# Altium schematic sheet RV1126_AUDIO_SHEET.SchDoc
size A4; SheetNumber: 13; SheetTotal: 28
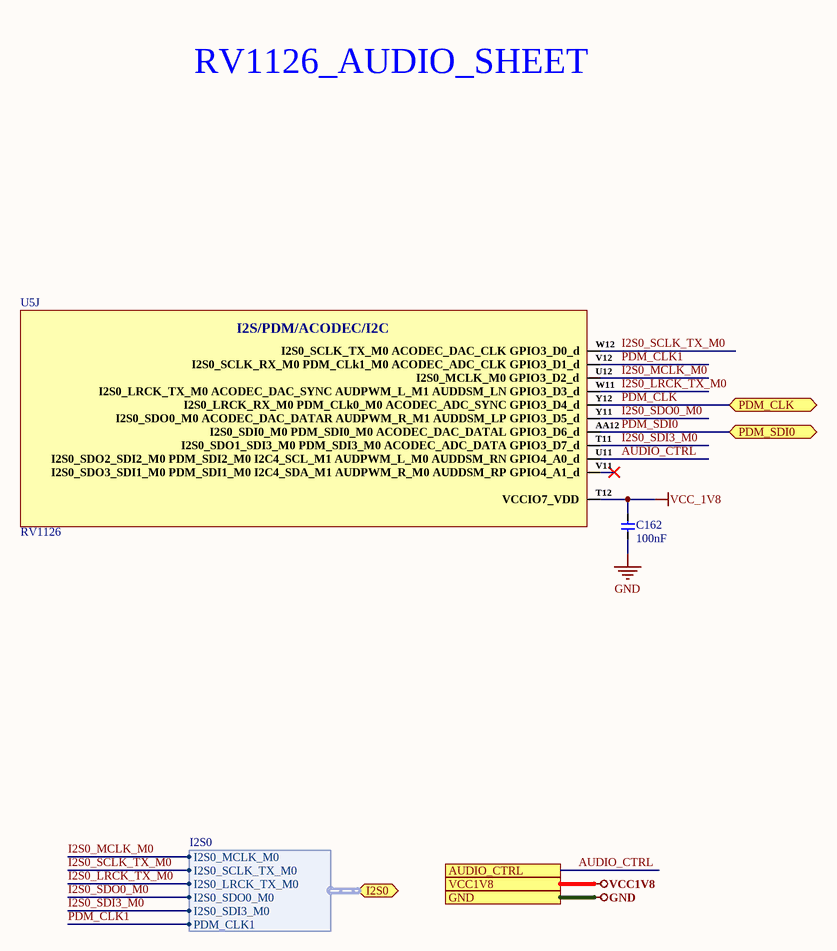
[diagram p0: RV1126_AUDIO_SHEET.SchDoc]

## Parts
C162  100nF  [CAP-0201]
U5  RV1126  [FCCSP-409(14x14)]  (part J of 15)

## Ports
AUDIO_CTRL (see SPEARKER_INTERFACE_SHEET[3C]), GND (see BUCK_CONTROLLER_SHEET2[3D], BUCK_CONVERTER_SHEET1[3D], DDR3_SDRAM_SHEET[5D], DEBUG_UART_INTERFACE[3D], DIGITAL_MEMS_INTERFACE[3C], eMMC_INTERFACE[3D], ETH_PoE-PD_INTERFACE[4D], ETH_SWITCH_INTERFACE[5D], IR-CUT_LIGHT SENSOR_SHEET[3D], MIPI TO HDMI_MODULE[3D], MIPI-CSI_RXX_INTERFACE[3C], PoE_PSE_CONTROLLER[5D], POWER_LDO_SHEET[3D], POWER_PMIC_RK809_CODEC[3C], POWER_PMIC_RK809_DC DC[3D], POWER_PMIC_RK809_LDO[4C], POWER_PMIC_RK809_MGM[3D], RV1126_DRAM_SHEET[4C], RV1126_eMMC_SPI-FLASH[3C], RV1126_ETHERNET_SHEET[3D], RV1126_OSC-PLL-PMUIO[3C], RV1126_POWER_SHEET[1D], RV1126_SARADC_SHEET[3C], RV1126_SDMMC_SHEET[3C], SPEARKER_INTERFACE_SHEET[3C], SPI_FLASH_INTERFACE[3D], USB2.0_DEBUG_UART[3D]), I2S0 (bidir, harness I2S0, see POWER_PMIC_RK809_CODEC[3C]), PDM_CLK (bidir, see DIGITAL_MEMS_INTERFACE[3C]), PDM_SDI0 (bidir, see DIGITAL_MEMS_INTERFACE[3C]), VCC1V8 (see DIGITAL_MEMS_INTERFACE[3C], IR-CUT_LIGHT SENSOR_SHEET[3D], MIPI TO HDMI_MODULE[3D], MIPI-CSI_RXX_INTERFACE[3C], POWER_PMIC_RK809_LDO[4C], POWER_PMIC_RK809_MGM[3D], RV1126_eMMC_SPI-FLASH[3C], RV1126_ETHERNET_SHEET[3D], RV1126_OSC-PLL-PMUIO[3C], RV1126_SARADC_SHEET[3C], RV1126_SDMMC_SHEET[3C], USB2.0_DEBUG_UART[3D])

## Harnesses
I2S0: I2S0_MCLK_M0, I2S0_SCLK_TX_M0, I2S0_LRCK_TX_M0, I2S0_SDO0_M0, I2S0_SDI3_M0, PDM_CLK1

## Nets
GND: C162.1 ; port GND
VCC1V8: port VCC1V8
VCC_1V8: C162.2 U5.T12(VCCIO7_VDD)
AUDIO_CTRL: U5.U11(I2S0_SDO2_SDI2_M0_PDM_SDI2_M0_I2C4_SCL_M1_AUDPWM_L_M0_AUDDSM_RN_GPIO4_A0_d) ; port AUDIO_CTRL
I2S0_LRCK_TX_M0: U5.W11(I2S0_LRCK_TX_M0_ACODEC_DAC_SYNC_AUDPWM_L_M1_AUDDSM_LN_GPIO3_D3_d) ; port I2S0.I2S0_LRCK_TX_M0
I2S0_MCLK_M0: U5.U12(I2S0_MCLK_M0_GPIO3_D2_d) ; port I2S0.I2S0_MCLK_M0
I2S0_SCLK_TX_M0: U5.W12(I2S0_SCLK_TX_M0_ACODEC_DAC_CLK_GPIO3_D0_d) ; port I2S0.I2S0_SCLK_TX_M0
I2S0_SDI3_M0: U5.T11(I2S0_SDO1_SDI3_M0_PDM_SDI3_M0_ACODEC_ADC_DATA_GPIO3_D7_d) ; port I2S0.I2S0_SDI3_M0
I2S0_SDO0_M0: U5.Y11(I2S0_SDO0_M0_ACODEC_DAC_DATAR_AUDPWM_R_M1_AUDDSM_LP_GPIO3_D5_d) ; port I2S0.I2S0_SDO0_M0
PDM_CLK: U5.Y12(I2S0_LRCK_RX_M0_PDM_CLk0_M0_ACODEC_ADC_SYNC_GPIO3_D4_d) ; port PDM_CLK
PDM_CLK1: U5.V12(I2S0_SCLK_RX_M0_PDM_CLk1_M0_ACODEC_ADC_CLK_GPIO3_D1_d) ; port I2S0.PDM_CLK1
PDM_SDI0: U5.AA12(I2S0_SDI0_M0_PDM_SDI0_M0_ACODEC_DAC_DATAL_GPIO3_D6_d) ; port PDM_SDI0

Not connected (* = marked no-connect by the designer): U5 V11(I2S0_SDO3_SDI1_M0_PDM_SDI1_M0_I2C4_SDA_M1_AUDPWM_R_M0_AUDDSM_RP_GPIO4_A1_d)*

## Notes on the sheet
- RV1126_AUDIO_SHEET
- File:
- Title:
- Date:
- Page
- Num:
- Total:
- Drawn By: Huzaifa Ali
- (in symbol RV1126, part J) I2S/PDM/ACODEC/I2C

## Library data of the parts
C162 = CC0201KRX5R6BB104: CAP CER 0.1UF 10V X5R 0201; Manufacturer: Yageo; Tolerance: 10%; Supplier 1: Mouser; Manufacturer Part Number: CC0201KRX5R6BB104; RoHS: Yes; Category: Ceramic Capacitors; Stock 1: 824403; Pricing 1: 1=0.10000, 10=0.02400, 50=0.02400, 100=0.01900, 1000=0.01100, 10000=0.00900 (USD); Mount: Surface Mount; Case/Package: 0201; Case Code (Imperial): 0201; Case Code (Metric): 0603; Weight: 6E-06oz; Min Operating Temperature: -55°C; Max Operating Temperature: 85°C; Capacitance: 100nF; Dielectric: X5R; Voltage Rating (DC): 10V; Packaging: Tape and Reel; Termination: SMD/SMT; Resistor Type: Ceramic; Voltage Rating: 10V; Series: CC; Construction: Flat; Length: 0.6mm; Width: 0.012inch; Height: 0.3mm; Thickness: 0.013inch; Depth: 0.3mm; Radiation Hardening: No; Lead Free: Lead Free; Halogen Free: Halogen Free; RoHS Compliant: Yes; ComponentLink1URL: https://datasheet.ciiva.com/11587/upy-gphc-x5r-4v-to-50v-12-11587190.pdf?src-supplier=Avnet; ComponentLink1Description: https://datasheet.ciiva.com/11587/upy-gphc-x5r-4v-to-50v-12-11587190.pdf?src-supplier=Avnet; Supplier Part Number 1: 603-CC201KRX5R6BB104; LCSC Part Number: C190183
U5 = RV1126: FCCSP-409(14x14) Microcontroller Units (MCUs/MPUs/SOCs) ROHS; Manufacturer: Rockchip; Manufacturer Part Number: RV1126; Package: FCCSP-409(14x14); LCSC Part Number: C2859017; Item Type: Microcontroller; ComponentLink1Description: LCSC; ComponentLink1URL: https://www.lcsc.com/product-detail/Microcontroller-Units-MCUs-MPUs-SOCs_Rockchip-RV1126_C2859017.html